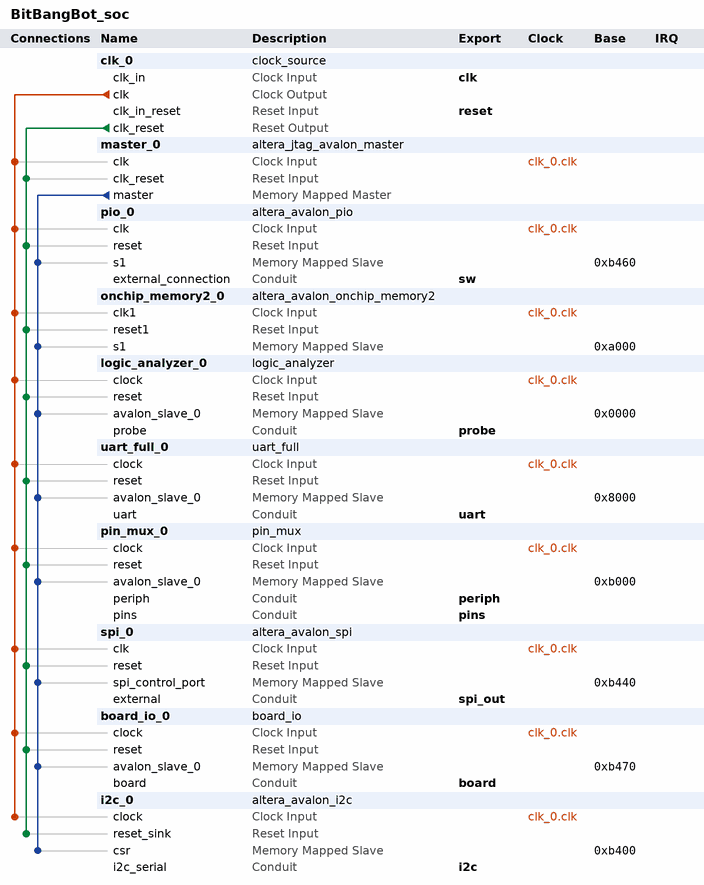
[diagram p0: system contents]
# Platform Designer (Qsys) system BitBangBot_soc, MAX 10 10M50DAF484C6GES
# Parameters at their usual value, and those the tool derives, are not listed.
package require -exact qsys 25.1
create_system BitBangBot_soc
set_project_property DEVICE_FAMILY {MAX 10}
set_project_property DEVICE 10M50DAF484C6GES

add_instance clk_0 clock_source 25.1
set_instance_parameter_value clk_0 clockFrequency 50000000

add_instance master_0 altera_jtag_avalon_master 25.1

add_instance pio_0 altera_avalon_pio 25.1
set_instance_parameter_value pio_0 direction Input
set_instance_parameter_value pio_0 width 10

add_instance onchip_memory2_0 altera_avalon_onchip_memory2 25.1
set_instance_parameter_value onchip_memory2_0 dataWidth 32
set_instance_parameter_value onchip_memory2_0 dualPort false
set_instance_parameter_value onchip_memory2_0 initMemContent false
set_instance_parameter_value onchip_memory2_0 initializationFileName onchip_mem.hex
set_instance_parameter_value onchip_memory2_0 memorySize 4096

add_instance logic_analyzer_0 logic_analyzer 1.0
set_instance_parameter_value logic_analyzer_0 ABITS 13
set_instance_parameter_value logic_analyzer_0 BUF_WORDS 2048
set_instance_parameter_value logic_analyzer_0 WIDTH 32

add_instance uart_full_0 uart_full 1.0
set_instance_parameter_value uart_full_0 ABITS 11
set_instance_parameter_value uart_full_0 BAUD 115200
set_instance_parameter_value uart_full_0 BUF_LEN 256
set_instance_parameter_value uart_full_0 CLK_FREQ 50000000

add_instance pin_mux_0 pin_mux 1.0
set_instance_parameter_value pin_mux_0 ABITS 8
set_instance_parameter_value pin_mux_0 NPIN 8

add_instance spi_0 altera_avalon_spi 25.1
set_instance_parameter_value spi_0 clockPolarity 0
set_instance_parameter_value spi_0 dataWidth 8
set_instance_parameter_value spi_0 masterSPI true
set_instance_parameter_value spi_0 numberOfSlaves 1
set_instance_parameter_value spi_0 targetClockRate 1000000

add_instance board_io_0 board_io 1.0
set_instance_parameter_value board_io_0 ABITS 2

add_instance i2c_0 altera_avalon_i2c 25.1
set_instance_parameter_value i2c_0 FIFO_DEPTH 16

# connections
add_connection clk_0.clk board_io_0.clock clock
add_connection clk_0.clk i2c_0.clock clock
add_connection clk_0.clk logic_analyzer_0.clock clock
add_connection clk_0.clk master_0.clk clock
add_connection clk_0.clk onchip_memory2_0.clk1 clock
add_connection clk_0.clk pin_mux_0.clock clock
add_connection clk_0.clk pio_0.clk clock
add_connection clk_0.clk spi_0.clk clock
add_connection clk_0.clk uart_full_0.clock clock
add_connection clk_0.clk_reset board_io_0.reset reset
add_connection clk_0.clk_reset i2c_0.reset_sink reset
add_connection clk_0.clk_reset logic_analyzer_0.reset reset
add_connection clk_0.clk_reset master_0.clk_reset reset
add_connection clk_0.clk_reset onchip_memory2_0.reset1 reset
add_connection clk_0.clk_reset pin_mux_0.reset reset
add_connection clk_0.clk_reset pio_0.reset reset
add_connection clk_0.clk_reset spi_0.reset reset
add_connection clk_0.clk_reset uart_full_0.reset reset
add_connection master_0.master board_io_0.avalon_slave_0 avalon
set_connection_parameter_value master_0.master/board_io_0.avalon_slave_0 baseAddress 0xb470
add_connection master_0.master i2c_0.csr avalon
set_connection_parameter_value master_0.master/i2c_0.csr baseAddress 0xb400
add_connection master_0.master logic_analyzer_0.avalon_slave_0 avalon
set_connection_parameter_value master_0.master/logic_analyzer_0.avalon_slave_0 baseAddress 0x0000
add_connection master_0.master onchip_memory2_0.s1 avalon
set_connection_parameter_value master_0.master/onchip_memory2_0.s1 baseAddress 0xa000
add_connection master_0.master pin_mux_0.avalon_slave_0 avalon
set_connection_parameter_value master_0.master/pin_mux_0.avalon_slave_0 baseAddress 0xb000
add_connection master_0.master pio_0.s1 avalon
set_connection_parameter_value master_0.master/pio_0.s1 baseAddress 0xb460
add_connection master_0.master spi_0.spi_control_port avalon
set_connection_parameter_value master_0.master/spi_0.spi_control_port baseAddress 0xb440
add_connection master_0.master uart_full_0.avalon_slave_0 avalon
set_connection_parameter_value master_0.master/uart_full_0.avalon_slave_0 baseAddress 0x8000

# exported interfaces
add_interface board conduit end
set_interface_property board EXPORT_OF board_io_0.board
add_interface clk clock sink
set_interface_property clk EXPORT_OF clk_0.clk_in
add_interface i2c conduit end
set_interface_property i2c EXPORT_OF i2c_0.i2c_serial
add_interface periph conduit end
set_interface_property periph EXPORT_OF pin_mux_0.periph
add_interface pins conduit end
set_interface_property pins EXPORT_OF pin_mux_0.pins
add_interface probe conduit end
set_interface_property probe EXPORT_OF logic_analyzer_0.probe
add_interface reset reset sink
set_interface_property reset EXPORT_OF clk_0.clk_in_reset
add_interface spi_out conduit end
set_interface_property spi_out EXPORT_OF spi_0.external
add_interface sw conduit end
set_interface_property sw EXPORT_OF pio_0.external_connection
add_interface uart conduit end
set_interface_property uart EXPORT_OF uart_full_0.uart

set_interconnect_requirement {$system} qsys_mm.clockCrossingAdapter HANDSHAKE
set_interconnect_requirement {$system} qsys_mm.enableEccProtection FALSE
set_interconnect_requirement {$system} qsys_mm.insertDefaultSlave FALSE
set_interconnect_requirement {$system} qsys_mm.maxAdditionalLatency 1

save_system BitBangBot_soc.qsys
